# Altium schematic sheet Interfaces.SchDoc
size 594 x 420 mm; SheetNumber: 1; SheetTotal: 2
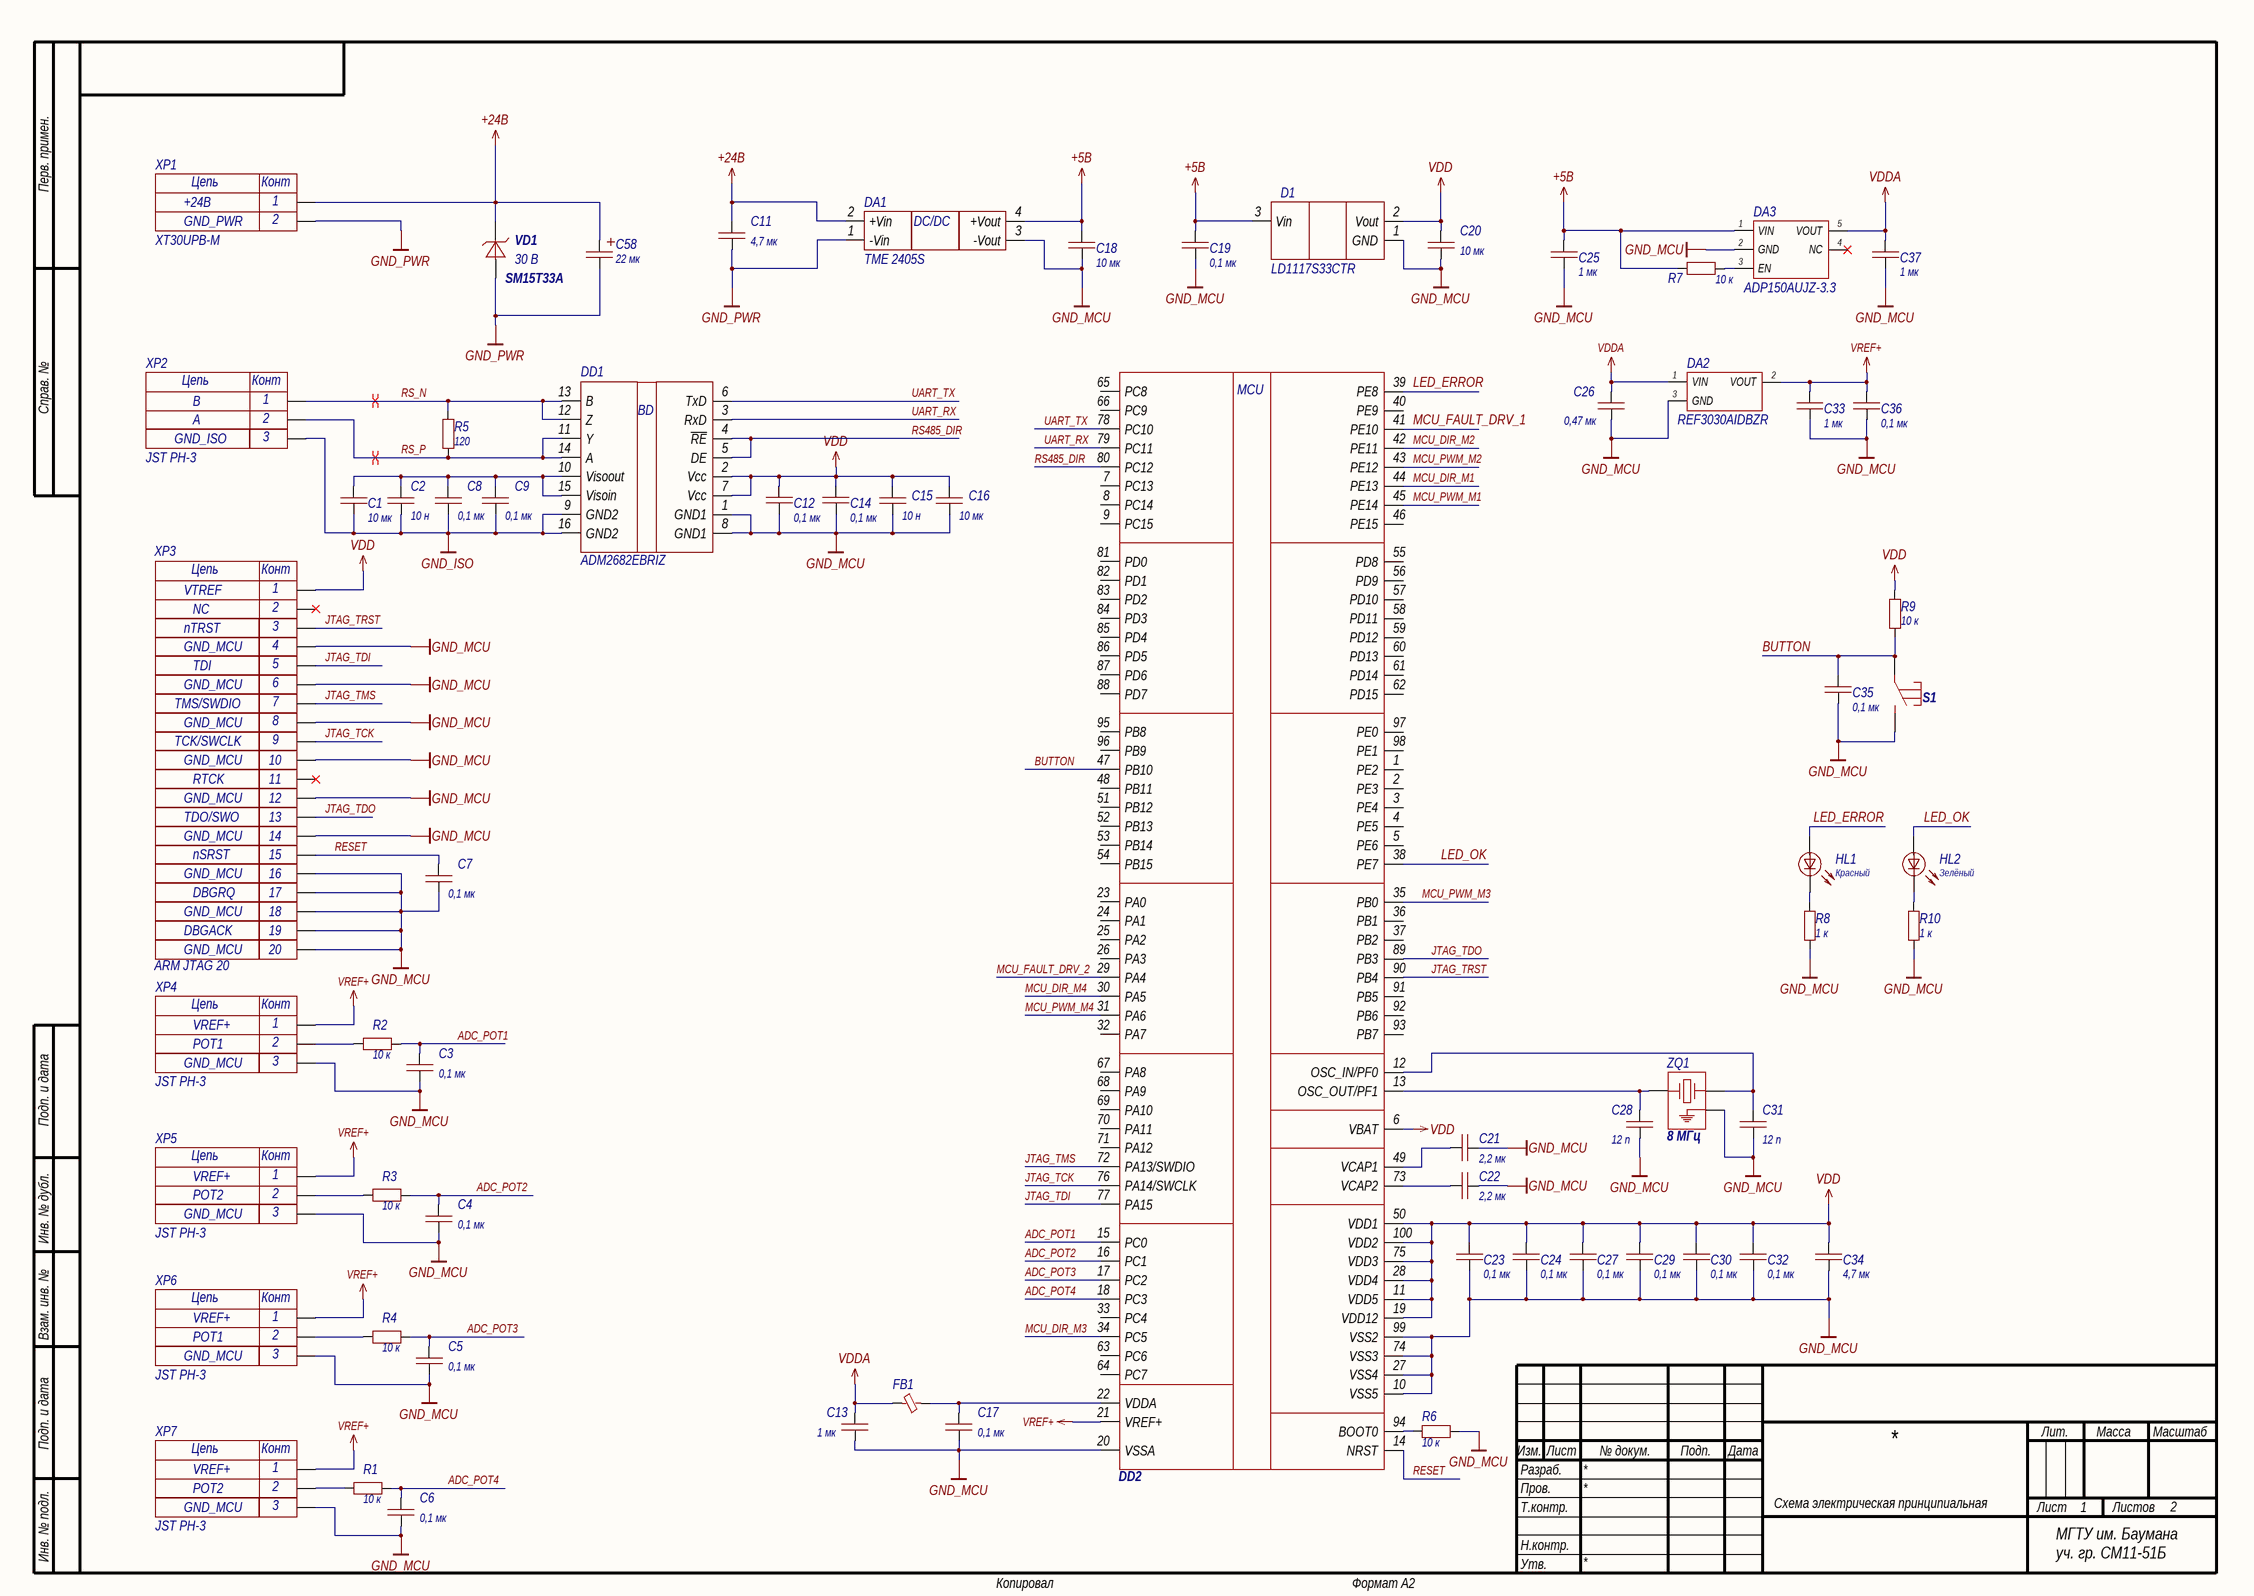
[diagram p0: Interfaces.SchDoc]

## Parts
C1  value 10 мк  [0603C]  (hidden comment: Capacitor)
C2  value 10 н  [0603C]  (hidden comment: Capacitor)
C3  value 0,1 мк  [0402C]  (hidden comment: Capacitor)
C4  value 0,1 мк  [0402C]  (hidden comment: Capacitor)
C5  value 0,1 мк  [0402C]  (hidden comment: Capacitor)
C6  value 0,1 мк  [0402C]  (hidden comment: Capacitor)
C7  value 0,1 мк  [0402C]  (hidden comment: Capacitor)
C8  value 0,1 мк  [0402C]  (hidden comment: Capacitor)
C9  value 0,1 мк  [0402C]  (hidden comment: Capacitor)
C11  value 4,7 мк  [1206C]  (hidden comment: Capacitor)
C12  value 0,1 мк  [0402C]  (hidden comment: Capacitor)
C13  value 1 мк  [0603C]  (hidden comment: Capacitor)
C14  value 0,1 мк  [0402C]  (hidden comment: Capacitor)
C15  value 10 н  [0603C]  (hidden comment: Capacitor)
C16  value 10 мк  [0603C]  (hidden comment: Capacitor)
C17  value 0,1 мк  [0402C]  (hidden comment: Capacitor)
C18  value 10 мк  [0603C]  (hidden comment: Capacitor)
C19  value 0,1 мк  [0402C]  (hidden comment: Capacitor)
C20  value 10 мк  [0603C]  (hidden comment: Capacitor)
C21  value 2,2 мк  [1206C]  (hidden comment: Capacitor)
C22  value 2,2 мк  [1206C]  (hidden comment: Capacitor)
C23  value 0,1 мк  [0402C]  (hidden comment: Capacitor)
C24  value 0,1 мк  [0402C]  (hidden comment: Capacitor)
C25  value 1 мк  [0603C]  (hidden comment: Capacitor)
C26  value 0,47 мк  [0603C]  (hidden comment: Capacitor)
C27  value 0,1 мк  [0402C]  (hidden comment: Capacitor)
C28  value 12 п  [0603C]  (hidden comment: Capacitor)
C29  value 0,1 мк  [0402C]  (hidden comment: Capacitor)
C30  value 0,1 мк  [0402C]  (hidden comment: Capacitor)
C31  value 12 п  [0603C]  (hidden comment: Capacitor)
C32  value 0,1 мк  [0402C]  (hidden comment: Capacitor)
C33  value 1 мк  [0603C]  (hidden comment: Capacitor)
C34  value 4,7 мк  [1206C]  (hidden comment: Capacitor)
C35  value 0,1 мк  [0402C]  (hidden comment: Capacitor)
C36  value 0,1 мк  [0402C]  (hidden comment: Capacitor)
C37  value 1 мк  [0603C]  (hidden comment: Capacitor)
C58  value 22 мк  [TC_A]  (hidden comment: Capacitor)
D1  LD1117S33CTR  [SOT223]
DA1  TME 2405S  [CONV_TME_2405S]
DA2  REF3030AIDBZR  [SOT23-3]
DA3  ADP150AUJZ-3.3  [SOT23-5]
DD1  ADM2682EBRIZ  [SOIC-16W]
DD2  STM32F407VGT6  [LQFP100]  (value not drawn)
FB1  BLM18AG102SN1D  [0603L]  (value not drawn)
HL1  value Красный  [0603D_red]  (hidden comment: LED 0603 RED)
HL2  value Зелёный  [0603D_green]  (hidden comment: LED 0603 GREEN)
R1  value 10 к  [0603R]  (hidden comment: Resistor)
R2  value 10 к  [0603R]  (hidden comment: Resistor)
R3  value 10 к  [0603R]  (hidden comment: Resistor)
R4  value 10 к  [0603R]  (hidden comment: Resistor)
R5  value 120  [0603R]  (hidden comment: Resistor)
R6  value 10 к  [0603R]  (hidden comment: Resistor)
R7  value 10 к  [0603R]  (hidden comment: Resistor)
R8  value 1 к  [0805R]  (hidden comment: Resistor)
R9  value 10 к  [0603R]  (hidden comment: Resistor)
R10  value 1 к  [0805R]  (hidden comment: Resistor)
S1  TSS-TD-19XA-XTR  [TSS-TD-19XA-XTR]  (value not drawn)
VD1  SM15T33A  value 30 В  [SMC]
XP1  XT30UPB-M  [XT30UPB-M]
XP2  JST PH-3  [JST_B3B-PH-K-S(LF)(SN)]
XP3  ARM JTAG 20  [3M_30320-6002HB]
XP4  JST PH-3  [JST_B3B-PH-K-S(LF)(SN)]
XP5  JST PH-3  [JST_B3B-PH-K-S(LF)(SN)]
XP6  JST PH-3  [JST_B3B-PH-K-S(LF)(SN)]
XP7  JST PH-3  [JST_B3B-PH-K-S(LF)(SN)]
ZQ1  value 8 МГц  [QSMD3.2x2.5]  (hidden comment: XTAL_GND)

## Nets
+5В: C18.2 C19.2 C25.2 D1.3(Vin) DA1.4(+Vout) DA3.1(VIN) R7.1
+24В: C11.2 C58.1 DA1.2(+Vin) VD1.2 XP1.1
GND_ISO: C1.1 C2.1 C8.1 C9.1 DD1.9(GND2) DD1.16(GND2) XP2.3
GND_MCU: C3.1 C4.1 C5.1 C6.1 C7.1 C12.2 C13.1 C14.2 C15.1 C16.1 C17.1 C18.1 C19.1 C20.1 C21.2 C22.2 C23.1 C24.1 C25.1 C26.1 C27.1 C28.1 C29.1 C30.1 C31.1 C32.1 C33.1 C34.1 C35.1 C36.1 C37.1 D1.1(GND) DA1.3(-Vout) DA2.3(GND) DA3.2(GND) DD1.1(GND1) DD1.8(GND1) DD2.10(VSS5) DD2.20(VSSA) DD2.27(VSS4) DD2.74(VSS3) DD2.99(VSS2) R6.1 R8.1 R10.1 S1.2 XP3.4 XP3.6 XP3.8 XP3.10 XP3.12 XP3.14 XP3.16 XP3.17 XP3.18 XP3.19 XP3.20 XP4.3 XP5.3 XP6.3 XP7.3 ZQ1.3
GND_PWR: C11.1 C58.2 DA1.1(-Vin) VD1.1 XP1.2
VDD: C12.1 C14.1 C15.2 C16.2 C20.2 C23.2 C24.2 C27.2 C29.2 C30.2 C32.2 C34.2 D1.2(Vout) DD1.2(Vcc) DD1.7(Vcc) DD2.6(VBAT) DD2.11(VDD5) DD2.19(VDD12) DD2.28(VDD4) DD2.50(VDD1) DD2.75(VDD3) DD2.100(VDD2) R9.2 XP3.1
VDDA: C13.2 C26.2 C37.2 DA2.1(VIN) DA3.5(VOUT) FB1.1
VREF+: C33.2 C36.2 DA2.2(VOUT) DD2.21(VREF+) XP4.1 XP5.1 XP6.1 XP7.1
ADC_POT1: C3.2 DD2.15(PC0) R2.2
ADC_POT2: C4.2 DD2.16(PC1) R3.2
ADC_POT3: C5.2 DD2.17(PC2) R4.2
ADC_POT4: C6.2 DD2.18(PC3) R1.2
BUTTON: C35.2 DD2.47(PB10) R9.1 S1.1
JTAG_TCK: DD2.76(PA14/SWCLK) XP3.9
JTAG_TDI: DD2.77(PA15) XP3.5
JTAG_TDO: DD2.89(PB3) XP3.13
JTAG_TMS: DD2.72(PA13/SWDIO) XP3.7
JTAG_TRST: DD2.90(PB4) XP3.3
LED_ERROR: DD2.39(PE8) HL1.1
LED_OK: DD2.38(PE7) HL2.1
MCU_DIR_M1: DD2.44(PE13)
MCU_DIR_M2: DD2.42(PE11)
MCU_DIR_M3: DD2.34(PC5)
MCU_DIR_M4: DD2.30(PA5)
MCU_FAULT_DRV_1: DD2.41(PE10)
MCU_FAULT_DRV_2: DD2.29(PA4)
MCU_PWM_M1: DD2.45(PE14)
MCU_PWM_M2: DD2.43(PE12)
MCU_PWM_M3: DD2.35(PB0)
MCU_PWM_M4: DD2.31(PA6)
RESET: C7.2 DD2.14(NRST) XP3.15
RS485_DIR: DD1.4(~{RE}) DD1.5(DE) DD2.80(PC12)
RS_N: DD1.12(Z) DD1.13(B) R5.2 XP2.1
RS_P: DD1.11(Y) DD1.14(A) R5.1 XP2.2
UART_RX: DD1.3(RxD) DD2.79(PC11)
UART_TX: DD1.6(TxD) DD2.78(PC10)
NetC1_2: C1.2 C2.2 C8.2 C9.2 DD1.10(Visoout) DD1.15(Visoin)
NetC17_2: C17.2 DD2.22(VDDA) FB1.2
NetC21_1: C21.1 DD2.49(VCAP1)
NetC22_1: C22.1 DD2.73(VCAP2)
NetC28_2: C28.2 DD2.13(OSC_OUT/PF1) ZQ1.1
NetC31_2: C31.2 DD2.12(OSC_IN/PF0) ZQ1.2
NetDA3_3: DA3.3(EN) R7.2
NetDD2_94: DD2.94(BOOT0) R6.2
NetHL1_2: HL1.2 R8.2
NetHL2_2: HL2.2 R10.2
NetR1_1: R1.1 XP7.2
NetR2_1: R2.1 XP4.2
NetR3_1: R3.1 XP5.2
NetR4_1: R4.1 XP6.2

Not connected (* = marked no-connect by the designer): DA3 4(NC)*; DD2 1(PE2) 2(PE3) 3(PE4) 4(PE5) 5(PE6) 7(PC13) 8(PC14) 9(PC15) 23(PA0) 24(PA1) 25(PA2) 26(PA3) 32(PA7) 33(PC4) 36(PB1) 37(PB2) 40(PE9) 46(PE15) 48(PB11) 51(PB12) 52(PB13) 53(PB14) 54(PB15) 55(PD8) 56(PD9) 57(PD10) 58(PD11) 59(PD12) 60(PD13) 61(PD14) 62(PD15) 63(PC6) 64(PC7) 65(PC8) 66(PC9) 67(PA8) 68(PA9) 69(PA10) 70(PA11) 71(PA12) 81(PD0) 82(PD1) 83(PD2) 84(PD3) 85(PD4) 86(PD5) 87(PD6) 88(PD7) 91(PB5) 92(PB6) 93(PB7) 95(PB8) 96(PB9) 97(PE0) 98(PE1); XP3 2* 11*

## Layout directives
differential pair: RS_N, RS_P

## Notes on the sheet
- +24В
- GND_PWR
- B
- GND_ISO
- A
- VTREF
- nTRST
- NC
- GND_MCU
- TDI
- TMS/SWDIO
- TCK/SWCLK
- RTCK
- TDO/SWO
- nSRST
- DBGACK
- DBGRQ
- VREF+
- POT1
- POT2
- Перв. примен.
- Справ. №
- Подп. и дата
- Инв. № дубл.
- Взам. инв. №
- Разраб.
- Изм.
- Лист
- № докум.
- Подп.
- Дата
- Лит.
- Масса
- Масштаб
- Пров.
- Т.контр.
- Схема электрическая принципиальная
- Листов
- Инв. № подл.
- Утв.
- Н.контр.
- МГТУ им. Баумана
- уч. гр. СМ11-51Б
- Копировал
- Формат А2
- (in symbol ADM2682EBRIZ) BD
- (in symbol ARM JTAG 20) Цепь; Конт
- (in symbol JST PH-3) Цепь; Конт
- (in symbol STM32F407VGT6) MCU
- (in symbol TME 2405S) DC/DC
- (in symbol XT30UPB-M) Цепь; Конт

## Library data of the parts
C1 C16 C18 C20 = Capacitor_10u_10_10V_X7R_0603C: Конденсатор 0603C ёмкостью 10 мк 10%, 10 В, X7R; Voltage (V): 10; Capacity (nF): 10000; Автор: glebmih; Datasheet: https://static.chipdip.ru/lib/893/DOC031893419.pdf; Part Number: Capacitor_10u_10_10V_X7R_0603C; Tolerance: 10%; Dielectric: X7R
C2 C15 = Capacitor_10n_10_50V_X7R_0603C: Конденсатор 0603C ёмкостью 10 н 10%, 50 В, X7R; Voltage (V): 50; Capacity (nF): 10; Part Number: Capacitor_10n_10_50V_X7R_0603C; Tolerance: 10%; Dielectric: X7R
C3-C9 C12 C14 C17 C19 C23 C24 C27 C29 C30 C32 C35 C36 = Capacitor_0,1u_10_16V_X7R_0603C: Конденсатор 0402C ёмкостью 0,1 мк 10%, 16 В, X7R; Voltage (V): 16; Capacity (nF): 100; Автор: rreali; Part Number: Capacitor_0,1u_10_16V_X7R_0603C; Tolerance: 10%; Dielectric: X7R
C11 C34 = Capacitor_4,7u_10_50V_X7R_1206C: Конденсатор 1206C ёмкостью 4,7 мк 10%, 50 В, X7R; Voltage (V): 50; Capacity (nF): 4700; Part Number: Capacitor_4,7u_10_50V_X7R_1206C; Tolerance: 10%; Dielectric: X7R
C13 C25 C33 C37 = Capacitor_1u_10_25V_X7R_0603C: Конденсатор 0603C ёмкостью 1 мк 10%, 25 В, X7R; Voltage (V): 25; Capacity (nF): 1000; Part Number: Capacitor_1u_10_25V_X7R_0603C; Tolerance: 10%; Dielectric: X7R
C21 C22 = Capacitor_2,2u_10_50V_X7R_1206C: Конденсатор 1206C ёмкостью 2,2 мк 10%, 50 В, X7R; Voltage (V): 50; Capacity (nF): 2200; Part Number: Capacitor_2,2u_10_50V_X7R_1206C; Tolerance: 10%; Dielectric: X7R
C26 = Capacitor_0,47u_10_50V_X7R_0603C: Конденсатор 0603C ёмкостью 0,47 мк 10%, 50 В, X7R; Voltage (V): 50; Capacity (nF): 470; Part Number: Capacitor_0,47u_10_50V_X7R_0603C; Tolerance: 10%; Dielectric: X7R
C28 C31 = Capacitor_12p_5_50V_NP0_0603C: Конденсатор 0603C ёмкостью 12 п 5%, 50 В, NP0; Voltage (V): 50; Capacity (nF): 0,012; Автор: glebmih; Part Number: Capacitor_12p_5_50V_NP0_0603C; Tolerance: 5%; Dielectric: NP0
C58 = Capacitor_22u_10_50V_TC_A: Танталовый конденсатор; Tolerance: 0,1; Voltage (V): 50; Type: Tantalum; Capacity (uF): 22; Part Number: Capacitor_22u_10_50V_TC_A
D1 = LD1117S33CTR: Линейный стабилизатор напряжения; Part Number: LD1117S33CTR
DA1 = TME 2405S: DC/DC преобразователь, 1Вт, вход 21.6-26.4В, выход 5В/ 200мА; Part Number: TME 2405S
DA2 = REF3030AIDBZR: Источник опорного напряжения, 3В; Автор: glebmih; Part Number: REF3030AIDBZR; Datasheet: https://static.chipdip.ru/lib/248/DOC000248445.pdf
DA3 = ADP150AUJZ-3.3: Стабилизатор напряжения 3.3В 150мА; Автор: glebmih; Part Number: ADP150AUJZ-3.3; Datasheet: https://static.chipdip.ru/lib/986/DOC003986581.pdf
DD1 = ADM2682EBRIZ: Изолированный RS-485 приемопередатчик, с встроенным DC-DC преобразователем; Part Number: ADM2682EBRIZ
DD2 = STM32F407VGT6: Микроконтроллер; Part Number: STM32F407VGT6
FB1 = BLM18AG102SN1D: Дроссель подавления ЭМП; Автор: glebmih; Part Number: BLM18AG102SN1D; Datasheet: https://www.chipdip.ru/product/blm18ag102sn1d-1-kom-0.4a-0603-drossel-podavleniya-murata-9000029220
HL1 = LED 0603 RED: Светодиод 0603 Красный; Автор: rreali; Part Number: LED 0603 RED
HL2 = LED 0603 GREEN: Светодиод 0603 Зелёный; Автор: rreali; Part Number: LED 0603 GREEN
R1-R4 R6 R7 R9 = Resistor_10k_1_0603: Резистор номиналом 10 кОм 1%; Power: *; Part Number: Resistor_10k_1_0603; Tolerance: 1%
R5 = Resistor_120_1_0603: Резистор номиналом 120 Ом 1%; Power: *; Part Number: Resistor_120_1_0603; Tolerance: 1%
R8 R10 = Resistor_1k_0805: Резистор номиналом 1 кОм 1%; Автор: glebmih; Power: *; Part Number: Resistor_1k_0805; Tolerance: 1%
S1 = TSS-TD-19XA-XTR: Тактовая кнопка; Автор: glebmih; Part Number: TSS-TD-19XA-XTR; Datasheet: https://cdn.promelec.ru/upload/items/2023/04/17/TSS-TD-19XA.pdf
VD1 = SM15T33A: Защитный диод на 30 В, рассеиваемая мощность 1500 Вт; Voltage (V): 30; Power (W): 1500; Part Number: SM15T33A
XP1 = XT30UPB-M: Вилка прямая силовая 2-контактная на плату, 15А, 500В; Автор: Гидролиба; Part Number: XT30UPB-M; Datasheet: https://www.tme.eu/en/details/xt30upb-m/dc-power-connectors/amass/
XP2 XP4-XP7 = JST PH-3: Вилка штыревая 3-контактная на плату прямая с ключом, шаг 2,0 мм; Автор: Макс; Part Number: JST PH-3; Datasheet: https://ihmevekotin.fi/liittimet/314-jst-ph-3-pinninen-liitaentaejohto.html
XP3 = ARM JTAG 20: Вилка штыревая двухрядная 20-контактная, шаг 2,54; Автор: Макс; Part Number: ARM JTAG 20; Datasheet: https://support.arm.com/documentation/dui0499/a/Target-Interface-Connections/ARM-JTAG-20
ZQ1 = XTAL_GND: Кварцевый резонатор с входом земли; Part Number: XTAL_GND